# Altium schematic sheet 5V-3V3_LDO_250mA_TI_0805.SchDoc
size A
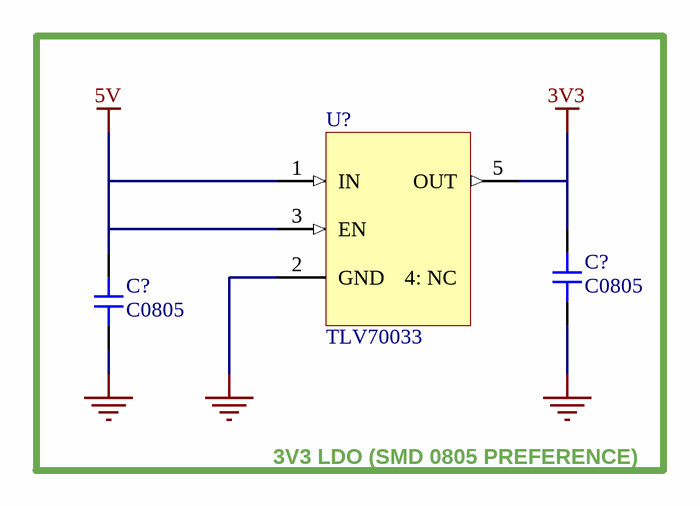
[diagram p0: 5V-3V3_LDO_250mA_TI_0805.SchDoc]

## Parts
(Parts that share a designator on the sheet are numbered #1, #2 ... from top to bottom, then left to right.)
C?#1  C0805  [MJB_CAP_0805]
C?#2  C0805  [MJB_CAP_0805]
U?  TLV70033  [MJB_TPS763x]

## Blocks framed on the sheet
3V3 LDO (SMD 0805 PREFERENCE): C?#1 C?#2 U?

## Nets
3V3: C?#1.2 U?.5(OUT)
5V: C?#2.2 U?.1(IN) U?.3(EN)
GND: C?#1.1 C?#2.1 U?.2(GND)

## Notes on the sheet
- (in symbol TPS76333) 4: NC

## Library data of the parts
C?#1 C?#2 = CAP_0805: Capacitor SMD 0805; Manufacturer: *; Manufacturer Part Number: *; Distributor Link: *; LCSC: *; Rating: *; Dielectric: *
U? = TPS76333: Texas Instruments 150mA 10V LDO Regulator